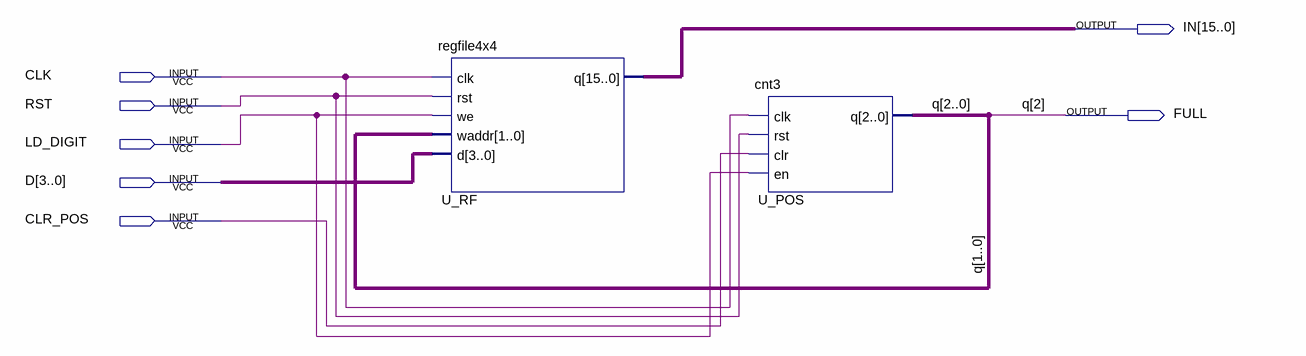
[diagram p0: schematic sheet]
// Quartus schematic block_input.bdf as structural Verilog: 2 symbols, 7 pins
module block_input (
  input  CLK,
  input  RST,
  input  LD_DIGIT,
  input  [3:0] D,
  input  CLR_POS,
  output [15:0] IN,
  output FULL
);

  wire [1:0] q;

  regfile4x4 U_RF (.clk(CLK), .rst(RST), .we(LD_DIGIT), .waddr(q), .d(D), .q(IN));
  cnt3 U_POS (.clk(CLK), .rst(RST), .clr(CLR_POS), .en(LD_DIGIT), .q({FULL, q}));

  // Other names for the same wires on the sheet: q[2] = FULL
endmodule
